# Altium schematic sheet NGUON_A313.SchDoc
size 1071 x 817 mm
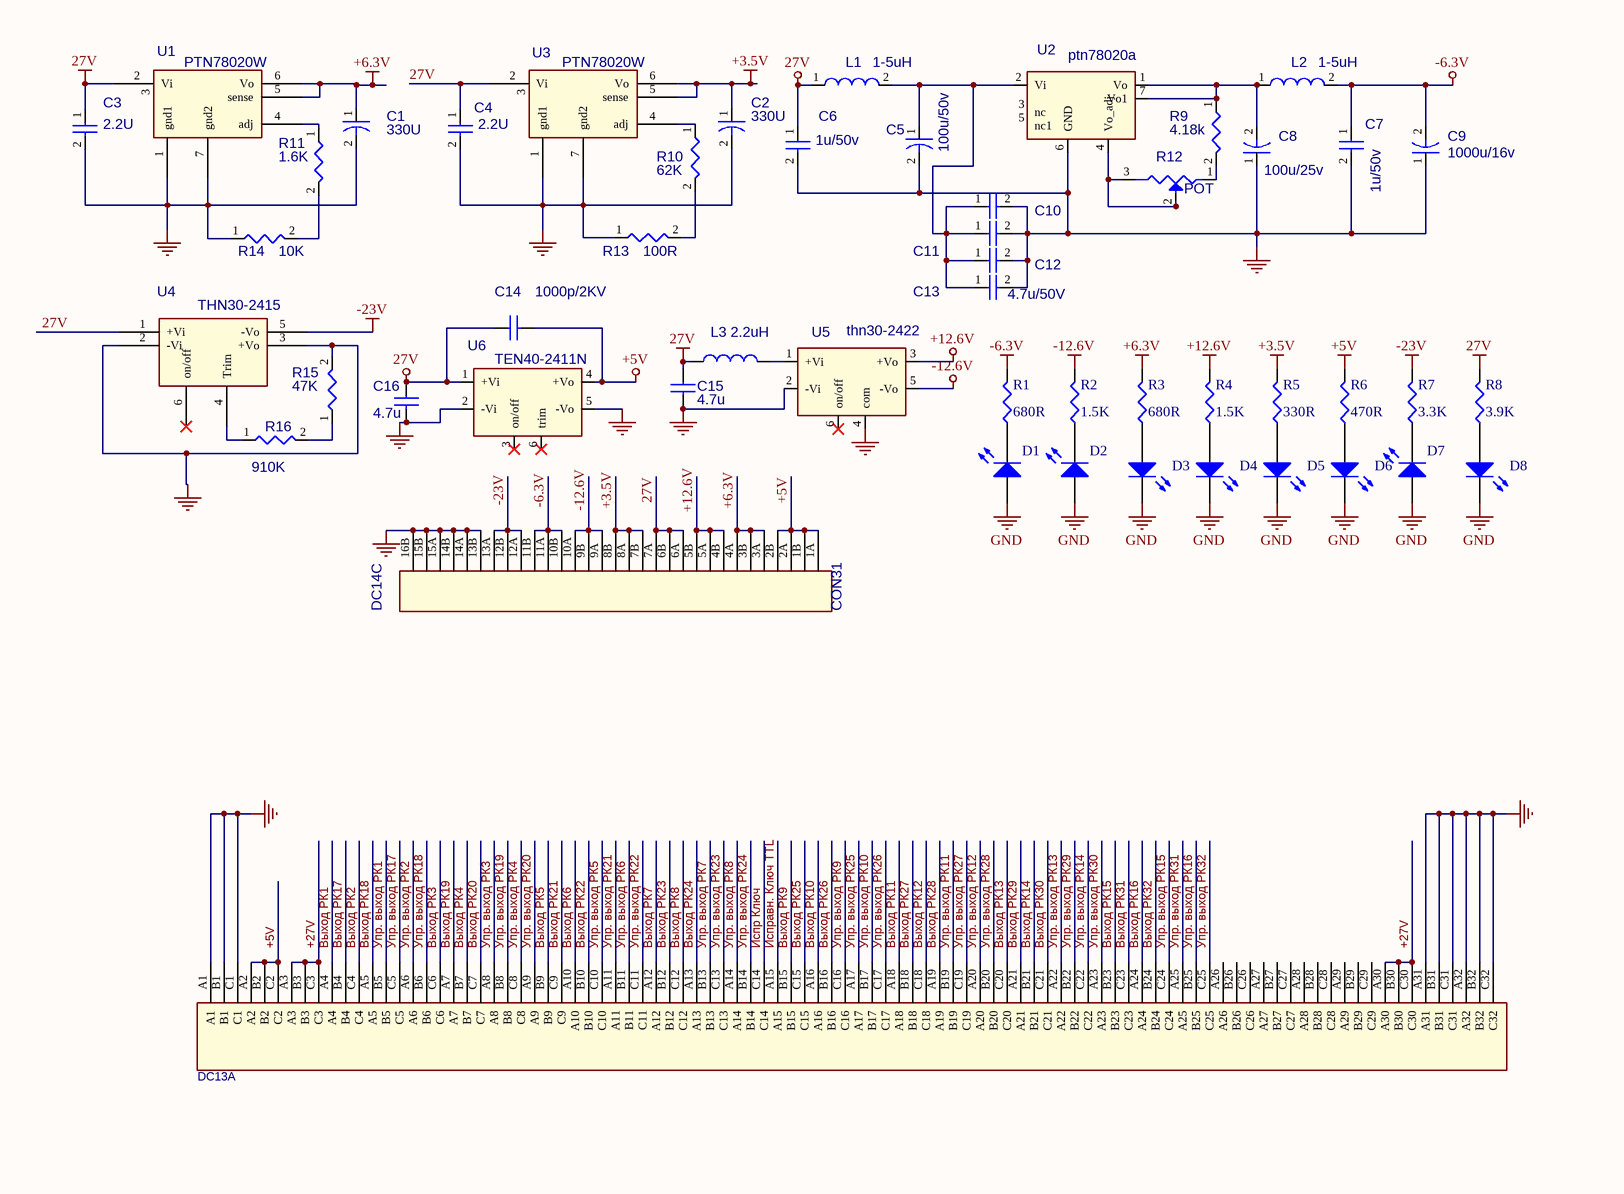
[diagram p0: NGUON_A313.SchDoc, top left]
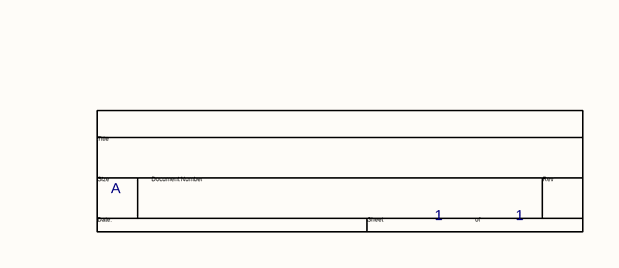
[diagram p1: NGUON_A313.SchDoc, bottom right]

## Parts
*  Page Size: A  Page Number: 1  (hidden comment: TitleBlock0)  (graphical)
C1  330U  [1206]
C2  330U  [1206]
C3  2.2U  [C0805]
C4  2.2U  [C0805]
C5  100u/50v  [1206]
C6  1u/50v  [C0805]
C7  1u/50v  [C0805]
C8  100u/25v  [1206]
C9  1000u/16v  [1206]
C10  4.7u/50V  [C0805]  (value not drawn)
C11  4.7u/50V  [C0805]  (value not drawn)
C12  4.7u/50V  [C0805]  (value not drawn)
C13  4.7u/50V  [C0805]
C14  1000p/2KV  [c1808]
C15  4.7u  [C0805]
C16  4.7u  [C0805]
D1  LED3  [CAPC2512L]  (value not drawn)
D2  LED3  [CAPC2512L]  (value not drawn)
D3  LED3  [CAPC2512L]  (value not drawn)
D4  LED3  [CAPC2512L]  (value not drawn)
D5  LED3  [CAPC2512L]  (value not drawn)
D6  LED3  [CAPC2512L]  (value not drawn)
D7  LED3  [CAPC2512L]  (value not drawn)
D8  LED3  [CAPC2512L]  (value not drawn)
DC13A  (no value)  [DC96C_CAI]
DC14C  CON31  [DC31C]
L1  1-5uH  [L_cuoncam]
L2  1-5uH  [L_cuoncam]
L3  2.2uH  [L_cuoncam]
R1  value 680R  [6-0805_N]  (hidden comment: Res3)
R2  value 1.5K  [6-0805_N]  (hidden comment: Res3)
R3  value 680R  [6-0805_N]  (hidden comment: Res3)
R4  value 1.5K  [6-0805_N]  (hidden comment: Res3)
R5  value 330R  [6-0805_N]  (hidden comment: Res3)
R6  value 470R  [6-0805_N]  (hidden comment: Res3)
R7  value 3.3K  [6-0805_N]  (hidden comment: Res3)
R8  value 3.9K  [6-0805_N]  (hidden comment: Res3)
R9  4.18k  [6-0805_N]
R10  62K  [6-0805_N]
R11  1.6K  [6-0805_N]
R12  POT  [R_bientro]
R13  100R  [6-0805_N]
R14  10K  [6-0805_N]
R15  47K  [6-0805_N]
R16  910K  [6-0805_N]
U1  PTN78020W  [PTN78020W]
U2  ptn78020a  [PTN78020W]
U3  PTN78020W  [PTN78020W]
U4  THN30-2415  [Thn30-2415]
U5  thn30-2422  [Thn30-2422-12V]
U6  TEN40-2411N  [TEN40]

## Nets
27V: C3.1 C4.1 C6.1 C14.1 C15.1 C16.1 DC14C.6A DC14C.6B DC14C.7A L1.1 L3.1 R8.2 U1.2(Vi) U3.2(Vi) U4.1(+Vi) U6.1(+Vi)
+3.5V: C2.1 DC14C.7B DC14C.8A DC14C.8B R5.2 U3.5(sense) U3.6(Vo)
+5V: C14.2 DC13A.A2 DC13A.B2 DC13A.C2 DC14C.1A DC14C.1B DC14C.2A DC14C.2B R6.2 U6.4(+Vo)
+6.3V: C1.1 DC14C.3A DC14C.3B DC14C.4A R3.2 U1.5(sense) U1.6(Vo)
+12.6V: DC14C.4B DC14C.5A DC14C.5B R4.2 U5.3(+Vo)
-6.3V: C7.1 C9.2 DC14C.10B DC14C.11A DC14C.11B L2.2 R1.2
-12.6V: DC14C.9A DC14C.9B DC14C.10A R2.2 U5.5(-Vo)
-23V: DC14C.12A DC14C.12B DC14C.13A R7.2 U4.5(-Vo)
GND: C1.2 C2.2 C3.2 C4.2 C5.2 C6.2 C7.2 C8.1 C9.1 C10.2 C11.2 C12.2 C13.2 C15.2 C16.2 D1.1(A) D2.1(A) D3.2(K) D4.2(K) D5.2(K) D6.2(K) D7.1(A) D8.2(K) DC13A.A1 DC13A.A31 DC13A.A32 DC13A.B1 DC13A.B31 DC13A.B32 DC13A.C1 DC13A.C31 DC13A.C32 DC14C.13B DC14C.14A DC14C.14B DC14C.15A DC14C.15B DC14C.16B R13.1 R14.1 R15.2 U1.1(gnd1) U1.7(gnd2) U2.6(GND) U3.1(gnd1) U3.7(gnd2) U4.2(-Vi) U4.3(+Vo) U5.2(-Vi) U5.4(com) U6.2(-Vi) U6.5(-Vo)
+27V: DC13A.A3 DC13A.A30 DC13A.B3 DC13A.B30 DC13A.C3 DC13A.C30
Выход РК1: DC13A.A4
Выход РК2: DC13A.C4
Выход РК3: DC13A.C6
Выход РК4: DC13A.B7
Выход РК5: DC13A.B9
Выход РК6: DC13A.A10
Выход РК7: DC13A.A12
Выход РК8: DC13A.C12
Выход РК9: DC13A.B15
Выход РК10: DC13A.A16
Выход РК11: DC13A.A18
Выход РК12: DC13A.C18
Выход РК13: DC13A.C20
Выход РК14: DC13A.B21
Выход РК15: DC13A.B23
Выход РК16: DC13A.A24
Выход РК17: DC13A.B4
Выход РК18: DC13A.A5
Выход РК19: DC13A.A7
Выход РК20: DC13A.C7
Выход РК21: DC13A.C9
Выход РК22: DC13A.B10
Выход РК23: DC13A.B12
Выход РК24: DC13A.A13
Выход РК25: DC13A.C15
Выход РК26: DC13A.B16
Выход РК27: DC13A.B18
Выход РК28: DC13A.A19
Выход РК29: DC13A.A21
Выход РК30: DC13A.C21
Выход РК31: DC13A.C23
Выход РК32: DC13A.B24
Испр Ключ: DC13A.C14
Исправн. Ключ TTL: DC13A.A15
Упр. выхoд РК1: DC13A.B5
Упр. выхoд РК2: DC13A.A6
Упр. выхoд РК3: DC13A.A8
Упр. выхoд РК4: DC13A.C8
Упр. выхoд РК5: DC13A.C10
Упр. выхoд РК6: DC13A.B11
Упр. выхoд РК7: DC13A.B13
Упр. выхoд РК8: DC13A.A14
Упр. выхoд РК9: DC13A.C16
Упр. выхoд РК10: DC13A.B17
Упр. выхoд РК11: DC13A.B19
Упр. выхoд РК12: DC13A.A20
Упр. выхoд РК13: DC13A.A22
Упр. выхoд РК14: DC13A.C22
Упр. выхoд РК15: DC13A.C24
Упр. выхoд РК16: DC13A.B25
Упр. выхoд РК17: DC13A.C5
Упр. выхoд РК18: DC13A.B6
Упр. выхoд РК19: DC13A.B8
Упр. выхoд РК20: DC13A.A9
Упр. выхoд РК21: DC13A.A11
Упр. выхoд РК22: DC13A.C11
Упр. выхoд РК23: DC13A.C13
Упр. выхoд РК24: DC13A.B14
Упр. выхoд РК25: DC13A.A17
Упр. выхoд РК26: DC13A.C17
Упр. выхoд РК27: DC13A.C19
Упр. выхoд РК28: DC13A.B20
Упр. выхoд РК29: DC13A.B22
Упр. выхoд РК30: DC13A.A23
Упр. выхoд РК31: DC13A.A25
Упр. выхoд РК32: DC13A.C25
NetC5_1: C5.1 C10.1 C11.1 C12.1 C13.1 L1.2 U2.2(Vi)
NetC8_2: C8.2 L2.1 R9.1 U2.1(Vo) U2.7(Vo1)
NetD1_2: D1.2(K) R1.1
NetD2_2: D2.2(K) R2.1
NetD3_1: D3.1(A) R3.1
NetD4_1: D4.1(A) R4.1
NetD5_1: D5.1(A) R5.1
NetD6_1: D6.1(A) R6.1
NetD7_2: D7.2(K) R7.1
NetD8_1: D8.1(A) R8.1
NetL3_2: L3.2 U5.1(+Vi)
NetR9_2: R9.2 R12.1(A)
NetR10_1: R10.1 U3.4(adj)
NetR10_2: R10.2 R13.2
NetR11_1: R11.1 U1.4(adj)
NetR11_2: R11.2 R14.2
NetR12_2: R12.2(WIPER) R12.3(B) U2.4(Vo_adj)
NetR15_1: R15.1 R16.2
NetR16_1: R16.1 U4.4(Trim)

Not connected (* = marked no-connect by the designer): DC13A A26 A27 A28 A29 B26 B27 B28 B29 C26 C27 C28 C29; U1 3(/inhibit); U2 3(nc) 5(nc1); U3 3(/inhibit); U4 6(on/off)*; U5 6(on/off)*; U6 3(on/off)* 6(trim)*

## Notes on the sheet
- (in symbol TitleBlock0) Title; Size; Document Number; Rev; Date:; Sheet; of

## Library data of the parts
C1 C2 C5 C8 C9 = CAPACITOR
C3 C4 C6 C7 C10-C13 = CAP NP
C14-C16 = CAPACITOR NON-POL
D1-D8 = LED3: Typical BLUE SiC LED; Published: 8-Jun-2000; LatestRevisionDate: 17-Dec-2003; LatestRevisionNote: PCB Footprint replaced.; DatasheetVersion: 16-Apr-2002; PackageVersion: 16-Apr-2002; PackageReference: 3.5X2.8X1.9; Publisher: Altium Limited
DC13A = DC96c
L1 L2 = INDUCTOR
L3 = INDUCTOR_Dup1
R1-R8 = Res3: Resistor; Published: 8-Jun-2000; LatestRevisionDate: 29-May-2009; LatestRevisionNote: IPC-7351 Footprint Added.; PackageReference: J1-0603; Publisher: Altium Limited; PackageDescription: Chip Resistor
R9-R11 R13-R16 = RESISTOR
R12 = POT_Dup1
U1 U3 = ptn78020w_8
U2 = PTN78020A_0
U4 = thn30-2415_1
U6 = thn30-2422_0
* = TitleBlock0: Page Create Date: March  8, 1995; Page Count: 1